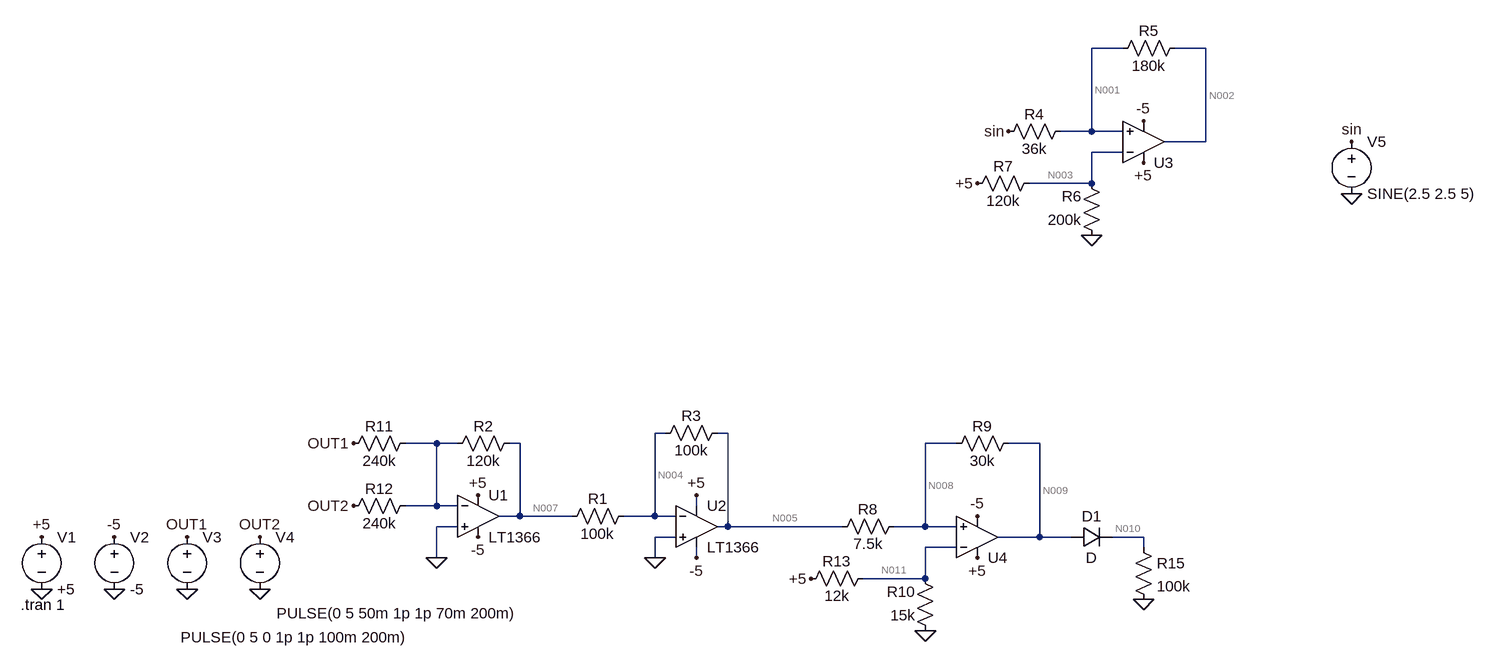
[diagram p0: schematic BatterieFaibleSimul.asc]
BatterieFaibleSimul.asc, the LTspice schematic file:
Version 4
SHEET 1 2932 680
WIRE 1616 -656 1568 -656
WIRE 1744 -656 1696 -656
WIRE 1568 -528 1568 -656
WIRE 1568 -528 1520 -528
WIRE 1616 -528 1568 -528
WIRE 1744 -512 1744 -656
WIRE 1744 -512 1680 -512
WIRE 1616 -496 1568 -496
WIRE 1568 -448 1568 -496
WIRE 1568 -448 1472 -448
WIRE 912 -64 896 -64
WIRE 1008 -64 992 -64
WIRE 560 -48 512 -48
WIRE 592 -48 560 -48
WIRE 688 -48 672 -48
WIRE 1360 -48 1312 -48
WIRE 1488 -48 1440 -48
WIRE 560 48 560 -48
WIRE 560 48 512 48
WIRE 592 48 560 48
WIRE 960 48 960 32
WIRE 688 64 688 -48
WIRE 688 64 656 64
WIRE 768 64 688 64
WIRE 896 64 896 -64
WIRE 896 64 848 64
WIRE 928 64 896 64
WIRE 592 80 560 80
WIRE 1008 80 1008 -64
WIRE 1008 80 992 80
WIRE 1184 80 1008 80
WIRE 1312 80 1312 -48
WIRE 1312 80 1264 80
WIRE 1360 80 1312 80
WIRE 928 96 896 96
WIRE 1488 96 1488 -48
WIRE 1488 96 1424 96
WIRE 1536 96 1488 96
WIRE 1648 96 1600 96
WIRE 1360 112 1312 112
WIRE 1648 112 1648 96
WIRE 560 128 560 80
WIRE 896 128 896 96
WIRE 960 128 960 112
WIRE 1312 160 1312 112
WIRE 1312 160 1216 160
FLAG -48 96 +5
FLAG 64 96 -5
FLAG 176 96 OUT1
FLAG 288 96 OUT2
FLAG -48 176 0
FLAG 64 176 0
FLAG 176 176 0
FLAG 288 176 0
FLAG 624 32 +5
FLAG 624 96 -5
FLAG 432 -48 OUT1
FLAG 432 48 OUT2
FLAG 560 128 0
FLAG 960 32 +5
FLAG 960 128 -5
FLAG 896 128 0
FLAG 1568 -368 0
FLAG 1968 -432 0
FLAG 1968 -512 sin
FLAG 1440 -528 sin
FLAG 1648 -480 +5
FLAG 1648 -544 -5
FLAG 1392 -448 +5
FLAG 1312 240 0
FLAG 1392 128 +5
FLAG 1392 64 -5
FLAG 1136 160 +5
FLAG 1648 192 0
SYMBOL voltage -48 80 R0
WINDOW 123 0 0 Left 2
WINDOW 39 0 0 Left 2
SYMATTR InstName V1
SYMATTR Value +5
SYMBOL voltage 64 80 R0
WINDOW 123 0 0 Left 2
WINDOW 39 0 0 Left 2
SYMATTR InstName V2
SYMATTR Value -5
SYMBOL voltage 176 80 R0
WINDOW 123 0 0 Left 2
WINDOW 39 0 0 Left 2
WINDOW 3 -10 170 Left 2
SYMATTR Value PULSE(0 5 0 1p 1p 100m 200m)
SYMATTR InstName V3
SYMBOL voltage 288 80 R0
WINDOW 123 0 0 Left 2
WINDOW 39 0 0 Left 2
WINDOW 3 26 133 Left 2
SYMATTR Value PULSE(0 5 50m 1p 1p 70m 200m)
SYMATTR InstName V4
SYMBOL Opamps\\LT1366 624 0 R0
SYMATTR InstName U1
SYMBOL Opamps\\LT1366 960 16 R0
SYMATTR InstName U2
SYMBOL res 416 -32 R270
WINDOW 0 27 56 VTop 2
WINDOW 3 5 56 VBottom 2
SYMATTR InstName R11
SYMATTR Value 240k
SYMBOL res 416 64 R270
WINDOW 0 27 56 VTop 2
WINDOW 3 5 56 VBottom 2
SYMATTR InstName R12
SYMATTR Value 240k
SYMBOL res 576 -32 R270
WINDOW 0 27 56 VTop 2
WINDOW 3 5 56 VBottom 2
SYMATTR InstName R2
SYMATTR Value 120k
SYMBOL res 864 48 R90
WINDOW 0 5 56 VBottom 2
WINDOW 3 27 56 VTop 2
SYMATTR InstName R1
SYMATTR Value 100k
SYMBOL res 1008 -80 R90
WINDOW 0 5 56 VBottom 2
WINDOW 3 27 56 VTop 2
SYMATTR InstName R3
SYMATTR Value 100k
SYMBOL res 1536 -544 R90
WINDOW 0 5 56 VBottom 2
WINDOW 3 27 56 VTop 2
SYMATTR InstName R4
SYMATTR Value 36k
SYMBOL res 1712 -672 R90
WINDOW 0 5 56 VBottom 2
WINDOW 3 27 56 VTop 2
SYMATTR InstName R5
SYMATTR Value 180k
SYMBOL res 1584 -352 R180
WINDOW 0 31 76 Left 2
WINDOW 3 31 40 Left 2
SYMATTR InstName R6
SYMATTR Value 200k
SYMBOL res 1488 -464 R90
WINDOW 0 5 56 VBottom 2
WINDOW 3 27 56 VTop 2
SYMATTR InstName R7
SYMATTR Value 120k
SYMBOL voltage 1968 -528 R0
WINDOW 123 0 0 Left 2
WINDOW 39 0 0 Left 2
SYMATTR InstName V5
SYMATTR Value SINE(2.5 2.5 5)
SYMBOL Opamps\\UniversalOpamp2 1648 -512 M180
SYMATTR InstName U3
SYMBOL res 1280 64 R90
WINDOW 0 5 56 VBottom 2
WINDOW 3 27 56 VTop 2
SYMATTR InstName R8
SYMATTR Value 7.5k
SYMBOL res 1456 -64 R90
WINDOW 0 5 56 VBottom 2
WINDOW 3 27 56 VTop 2
SYMATTR InstName R9
SYMATTR Value 30k
SYMBOL res 1328 256 R180
WINDOW 0 31 76 Left 2
WINDOW 3 31 40 Left 2
SYMATTR InstName R10
SYMATTR Value 15k
SYMBOL res 1232 144 R90
WINDOW 0 5 56 VBottom 2
WINDOW 3 27 56 VTop 2
SYMATTR InstName R13
SYMATTR Value 12k
SYMBOL Opamps\\UniversalOpamp2 1392 96 M180
SYMATTR InstName U4
SYMBOL res 1632 96 R0
SYMATTR InstName R15
SYMATTR Value 100k
SYMBOL diode 1536 112 R270
WINDOW 0 32 32 VTop 2
WINDOW 3 0 32 VBottom 2
SYMATTR InstName D1
TEXT -80 200 Left 2 !.tran 1

The netlist it stands for:
* BatterieFaibleSimul.asc
V1 +5 0 +5
V2 -5 0 -5
V3 OUT1 0 PULSE(0 5 0 1p 1p 100m 200m)
V4 OUT2 0 PULSE(0 5 50m 1p 1p 70m 200m)
XU1 0 N006 +5 -5 N007 LT1366  ; pins In+ In- V+ V- OUT
XU2 0 N004 +5 -5 N005 LT1366  ; pins In+ In- V+ V- OUT
R11 OUT1 N006 240k
R12 OUT2 N006 240k
R2 N006 N007 120k
R1 N004 N007 100k
R3 N005 N004 100k
R4 N001 sin 36k
R5 N002 N001 180k
R6 0 N003 200k
R7 N003 +5 120k
V5 sin 0 SINE(2.5 2.5 5)
XU3 N001 N003 +5 -5 N002 level.2 Avol=1Meg GBW=10Meg Slew=10Meg ilimit=25m rail=0 Vos=0 phimargin=45 en=0 enk=0 in=0 ink=0 Rin=500Meg  ; pins IN+ IN- V+ V- OUT
R8 N008 N005 7.5k
R9 N009 N008 30k
R10 0 N011 15k
R13 N011 +5 12k
XU4 N008 N011 +5 -5 N009 level.2 Avol=1Meg GBW=10Meg Slew=10Meg ilimit=25m rail=0 Vos=0 phimargin=45 en=0 enk=0 in=0 ink=0 Rin=500Meg  ; pins IN+ IN- V+ V- OUT
R15 N010 0 100k
D1 N009 N010 D
.model D D
.lib standard.dio
.tran 1
.lib LTC.lib
.lib UniversalOpamps2.sub
.backanno
.end

* Results of the author's LTspice run, read from the files saved beside the schematic
* Operating Point, zero values left out:
*   V(+5) = 5 V
*   V(-5) = -5 V
*   V(n007) = -1.199 mV
*   V(n004) = -44.79 nV
*   V(n005) = 199.8 µV
*   V(n001) = 1.25 V
*   V(sin) = 2.5 V
*   V(n002) = -5 V
*   V(n003) = 3.125 V
*   V(n008) = -999.5 mV
*   V(n009) = -4.999 V
*   V(n011) = 2.778 V
*   V(n010) = -500.9 nV
*   I(D1) = -5.009 pA
*   I(R15) = -5.009 pA
*   I(R13) = -185.2 µA
*   I(R10) = -185.2 µA
*   I(R9) = -133.3 µA
*   I(R8) = -133.3 µA
*   I(R7) = -15.63 µA
*   I(R6) = -15.62 µA
*   I(R5) = -34.72 µA
*   I(R4) = -34.72 µA
*   I(R3) = 1.999 nA
*   I(R1) = 11.99 nA
*   I(R2) = 9.995 nA
*   I(V5) = -34.72 µA
*   I(V2) = 847 µA
*   I(V1) = -1.013 mA
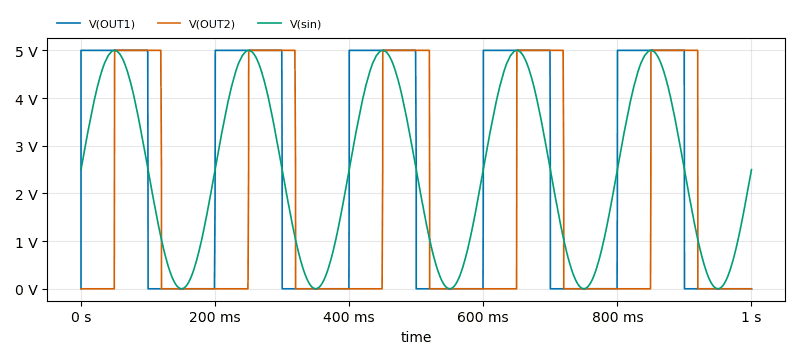
[diagram p1: Transient Analysis of BatterieFaibleSimul.asc, plotted from the saved traces]
* Transient Analysis, 1 run:
*   V(OUT1): min 0 V, max 5 V, average 2.498 V, rms 3.532 V, last 0 V
*   V(OUT2): min 0 V, max 5 V, average 1.75 V, rms 2.954 V, last 0 V
*   V(sin): min 589.3 µV, max 5 V, average 2.499 V, rms 3.063 V, last 2.5 V